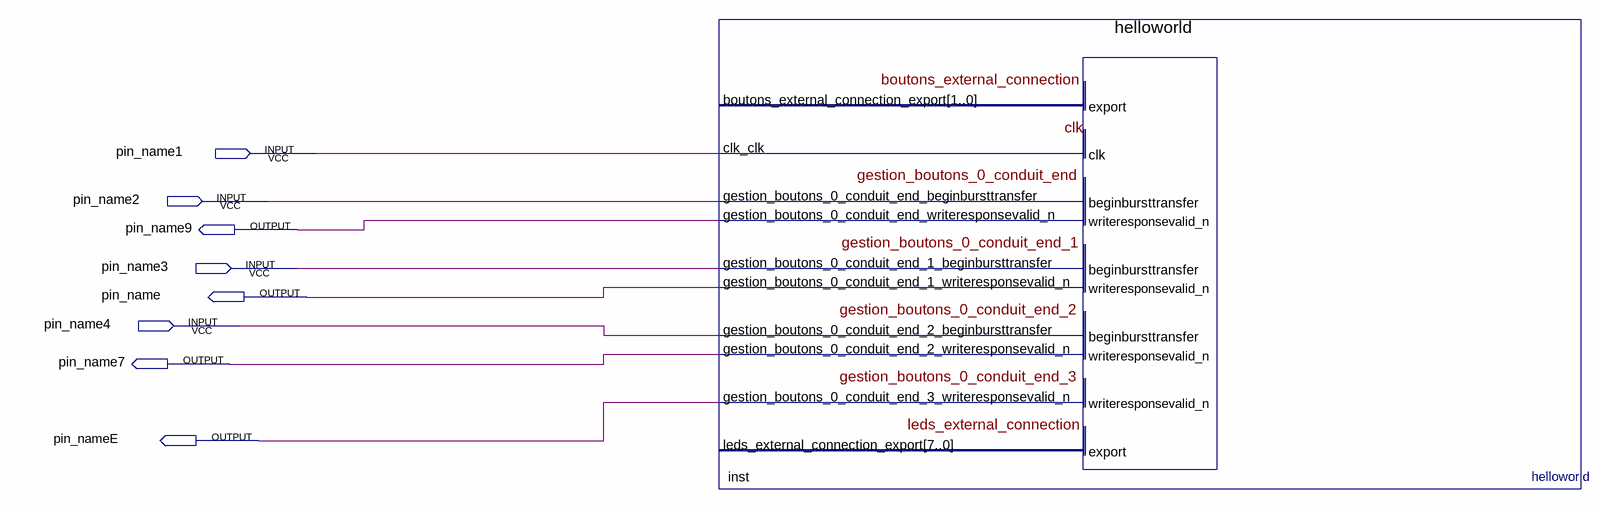
[diagram p0: schematic sheet]
// Quartus schematic Gboutons.bdf as structural Verilog: 1 symbols, 8 pins
module Gboutons (
  input  pin_name1,
  input  pin_name2,
  input  pin_name3,
  input  pin_name4,
  output pin_name9,
  output pin_name,
  output pin_name7,
  output pin_nameE
);

  helloworld inst (
    .clk_clk(pin_name1), .gestion_boutons_0_conduit_end_beginbursttransfer(pin_name2),
    .gestion_boutons_0_conduit_end_1_beginbursttransfer(pin_name3),
    .gestion_boutons_0_conduit_end_2_beginbursttransfer(pin_name4),
    .gestion_boutons_0_conduit_end_writeresponsevalid_n(pin_name9),
    .gestion_boutons_0_conduit_end_1_writeresponsevalid_n(pin_name),
    .gestion_boutons_0_conduit_end_2_writeresponsevalid_n(pin_name7),
    .gestion_boutons_0_conduit_end_3_writeresponsevalid_n(pin_nameE));  // open: boutons_external_connection_export, leds_external_connection_export
endmodule
